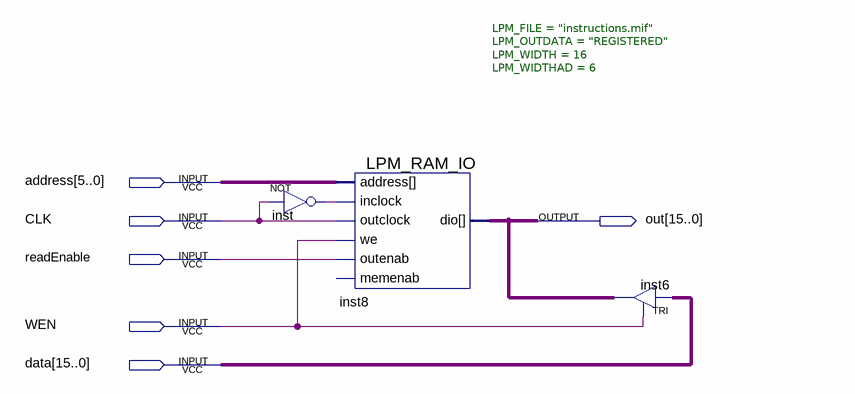
[diagram p0: schematic sheet]
// Quartus schematic InstructionMemory.bdf as structural Verilog: 3 symbols, 6 pins
module InstructionMemory (
  input  [5:0] address,
  input  CLK,
  input  readEnable,
  input  WEN,
  input  [15:0] data,
  output [15:0] out
);

  wire inst_out;

  not inst (inst_out, CLK);
  LPM_RAM_IO #(.LPM_FILE("instructions.mif"), .LPM_OUTDATA("REGISTERED"), .LPM_WIDTH(16), .LPM_WIDTHAD(6)) inst8 (
    .address(address), .outclock(CLK), .inclock(inst_out), .we(WEN), .outenab(readEnable), .dio(out));  // open: memenab
  TRI inst6[15:0] (.IN(data), .OE(WEN), .OUT(out));
endmodule
